# Altium schematic sheet 01_Cover.SchDoc
size 246 x 182 mm; DsnPath: C:\Users\nilot\Documents\VSCode\SBC\imports\SG2002_QFN88_38_20230301_4L_V1.3_16.2.DSN; SchematicName: CV181xC_QFN88_38_DemoBoard; PageName: 01_Cover; PageSize: A; TopSchematic: True
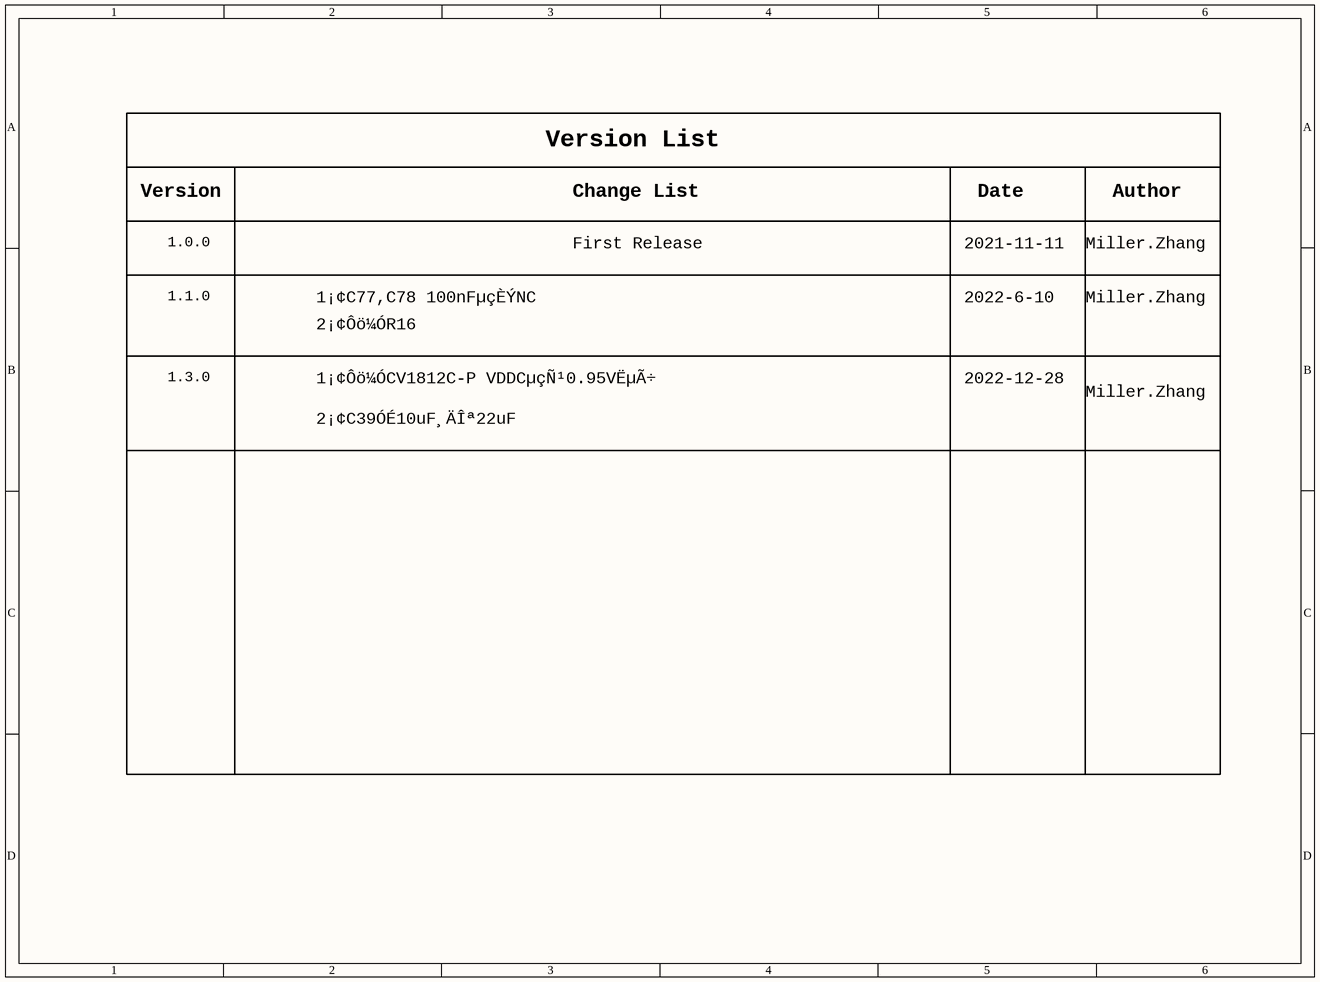
[diagram p0: 01_Cover.SchDoc]

## Notes on the sheet
- Version List
- Version
- 1.0.0
- First Release
- Change List
- 2021-11-11
- Date
- Miller.Zhang
- Author
- 1.1.0
- 1¡¢C77,C78 100nFµçÈÝNC
- 2¡¢Ôö¼ÓR16
- 2022-6-10
- 1.3.0
- 1¡¢Ôö¼ÓCV1812C-P VDDCµçÑ¹0.95VËµÃ÷
- 2022-12-28
- 2¡¢C39ÓÉ10uF¸ÄÎª22uF